# Altium project SGM2576YN5G_TR.PrjPcb
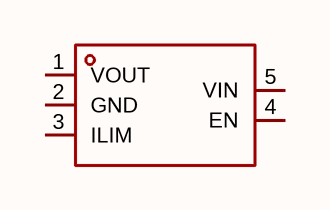
[diagram p0: SGM2576YN5G_TR.schdoc]
1 sheet, 1 parts. Net scope: global (net labels, ports and power ports of the same name join across sheets).

## Sheet SGM2576YN5G_TR.schdoc
size 127 x 101 mm

### Parts
U?  sgm2576yn5g/tr  [SOT-23-5_L2.9-W1.6-P0.95-LS2.8-TL]  (value not drawn)

### Nets

Not connected (* = marked no-connect by the designer): U? 1(VOUT) 2(GND) 3(ILIM) 4(EN) 5(VIN)

### Library data of the parts
U? = sgm2576yn5g/tr: 类型:负载开关;通道数:1;输入控制逻辑:高电平有效;工作电压:2.5V~5.5V;最大连续电流:2.5A;导通电阻:100mΩ;; Manufacturer: SGMICRO(圣邦微); AddInBom: yes; ModelId: 8842b967607c425db77b95059c9337d3; ModelTransform: 114.173,110.236,0,270,0,0,0,0,0; Number of Channels: 1; Control Input Logic: 高电平有效; Maximum Continuous Current: 2.5A; RDS(on): 100mΩ; Symbol: SGM2576YN5G/TR; LCSC Part Name: 单通道电源分配开关; SupplierPart: C699888; ManufacturerPart: SGM2576YN5G/TR; Supplier Footprint: SOT-23-5; JLCPCB Part Class: Extended Part; Datasheet: https://item.szlcsc.com/datasheet/SGM2576YN5G%252FTR/734562.html; Supplier: LCSC; ConvertToPcb: yes; FootprintName: SOT-23-5_L2.9-W1.6-P0.95-LS2.8-TL; ModelName: SOT-23-5_L2.9-W1.6-P0.95-LS2.8-TL; Type: 负载开关; Voltage - Supply: 2.5V~5.5V; Features: 过流保护；过温保护；欠压锁定；反向电流阻断；输出放电功能；软启动; Operating Temperature	-: -40℃~+85℃